# Altium project Smart-Switch-v1.1.PrjPcb (part 2 of 2)

## Sheet Power-Sheet.SchDoc
size A4; SheetNumber: 2; SheetTotal: 3
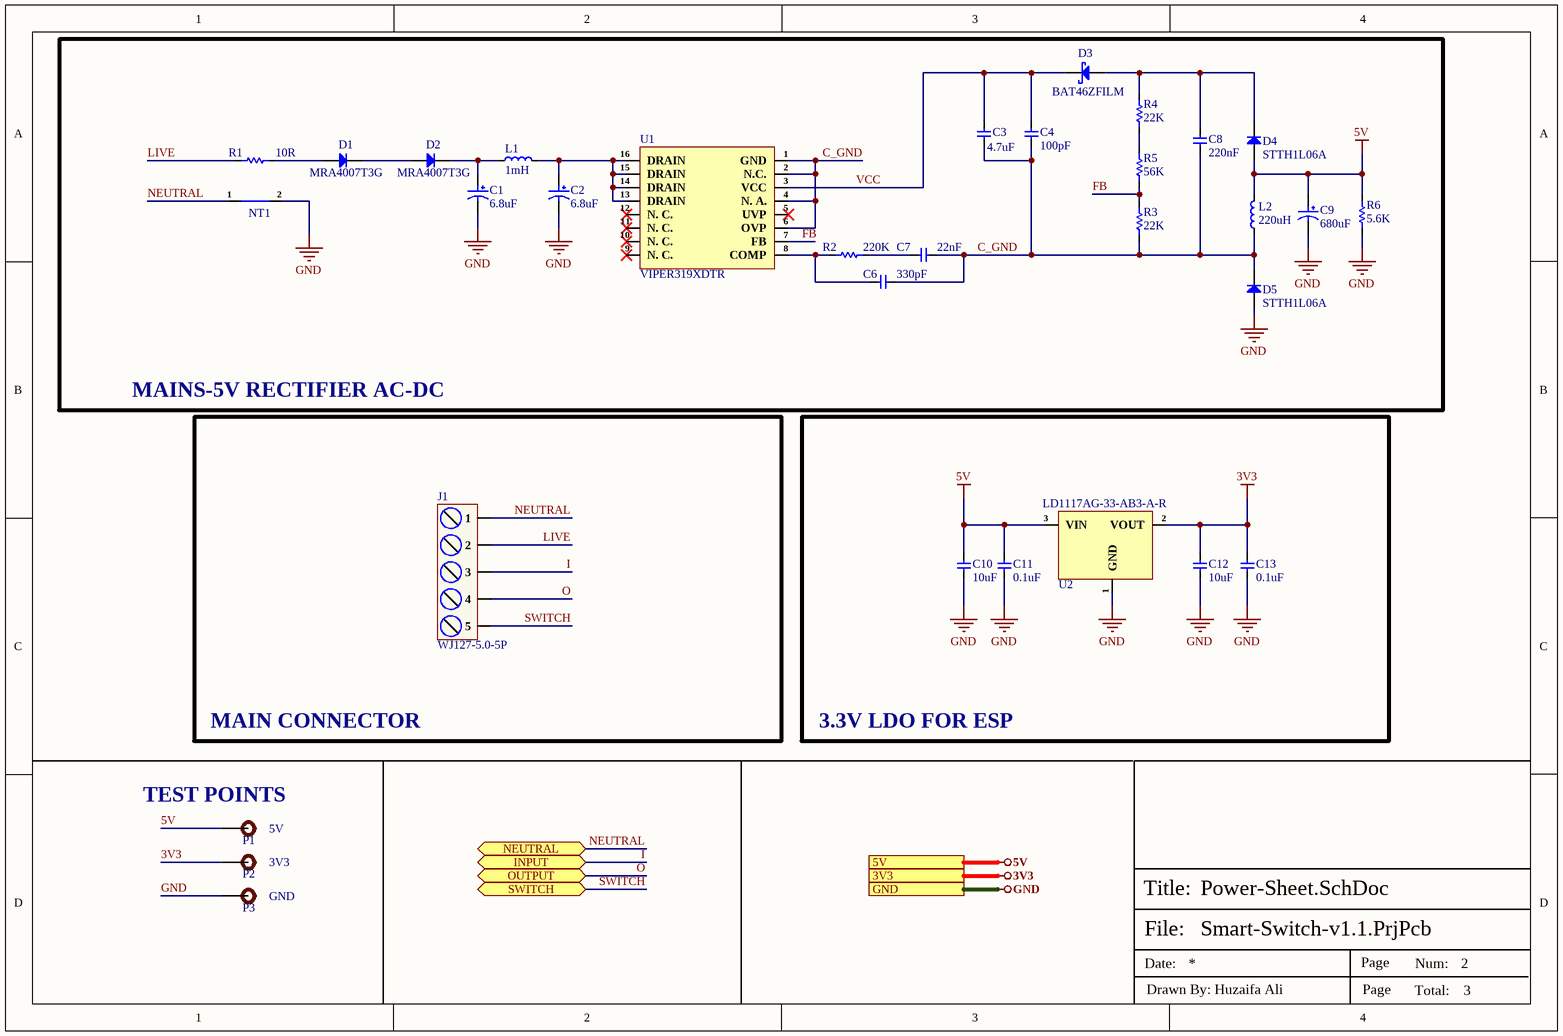
[diagram p2: Power-Sheet.SchDoc]

### Parts
C1  6.8uF  [6.8UF400V87EC0241]
C2  6.8uF  [6.8UF400V87EC0241]
C3  4.7uF  [Cap-1206]
C4  100pF  [Cap-0805]
C6  330pF  [Cap-0603]
C7  22nF  [Cap-0603]
C8  220nF  [Cap-1206]
C9  680uF  [SHW680UF10V6.3X11]
C10  10uF  [Cap-0603]
C11  0.1uF  [CAP-0201]
C12  10uF  [Cap-0402]
C13  0.1uF  [CAP-0201]
D1  MRA4007T3G  [SMA]
D2  MRA4007T3G  [SMA]
D3  BAT46ZFILM  [SOD-123]
D4  STTH1L06A  [SMA]
D5  STTH1L06A  [SMA]
J1  WJ127-5.0-5P  [WJ127-5.0-5P]
L1  1mH  [SPK0608-102MB]
L2  220uH  [YNR6045-221M]
NT1  Net Tie_SMD  [Net Tie Pad]  (value not drawn)  (net tie, no BOM)
P1  TEST POINT  [Test-point]  (value not drawn)
P2  TEST POINT  [Test-point]  (value not drawn)
P3  TEST POINT  [Test-point]  (value not drawn)
R1  10R  [MO2WS Vertical Type]
R2  220K  [Res-0603]
R3  22K  [Res-1206]
R4  22K  [Res-1206]
R5  56K  [Res-0603]
R6  5.6K  [RES-0805]
U1  VIPER319XDTR  [SOP-16]
U2  LD1117AG-33-AB3-A-R  [SOT-89-3]

### Blocks framed on the sheet
MAINS-5V RECTIFIER AC-DC: C1-C4 C6-C9 D1-D5 L1 L2 NT1 R1-R6 U1
MAIN CONNECTOR: J1
3.3V LDO FOR ESP: C10-C13 U2

### Ports
3V3 (see Top-Sheet[2B], Controller-Sheet[5D]), 5V (see Top-Sheet[2C], Controller-Sheet[5D]), GND (see Top-Sheet[2B], Controller-Sheet[5D]), INPUT (bidir, see Top-Sheet[2B], Controller-Sheet[5D]), NEUTRAL (bidir, see Top-Sheet[2C], Controller-Sheet[5D]), OUTPUT (bidir, see Top-Sheet[2B], Controller-Sheet[5D]), SWITCH (bidir, see Top-Sheet[2C], Controller-Sheet[5D])

### Nets
3V3: C12.2 C13.2 P2.1 U2.2(VOUT) ; port 3V3
5V: C9.1 C10.2 C11.2 D4.2(A) L2.2 P1.1 R6.2 U2.3(VIN) ; port 5V
GND: C1.2 C2.2 C9.2 C10.1 C11.1 C12.1 C13.1 D5.2(A) NT1.2 P3.1 R6.1 U2.1(GND) ; port GND
C_GND: C3.1 C4.1 C6.1 C7.1 C8.1 D5.1(K) L2.1 R3.1 U1.1(GND) U1.2(N.C.) U1.4(N._A.) U1.6(OVP)
FB: R3.2 R5.1 U1.7(FB)
I: J1.3 ; port INPUT
LIVE: J1.2 R1.2
NEUTRAL: J1.1 NT1.1 ; port NEUTRAL
O: J1.4 ; port OUTPUT
SWITCH: J1.5 ; port SWITCH
VCC: C3.2 C4.2 D3.2(K) U1.3(VCC)
NetC1_1: C1.1 D2.1(K) L1.1
NetC2_1: C2.1 L1.2 U1.13(DRAIN) U1.14(DRAIN) U1.15(DRAIN) U1.16(DRAIN)
NetC6_2: C6.2 R2.1 U1.8(COMP)
NetC7_2: C7.2 R2.2
NetC8_2: C8.2 D3.1(A) D4.1(K) R4.2
NetD1_1: D1.1(K) D2.2(A)
NetD1_2: D1.2(A) R1.1
NetR4_1: R4.1 R5.2

Not connected (* = marked no-connect by the designer): U1 5(UVP)* 9(N._C.)* 10(N._C.)* 11(N._C.)* 12(N._C.)*

### Notes on the sheet
- (near P1) TEST POINTS
- 5V
- 3V3
- GND
- File:
- Title:
- Date:
- Page
- Num:
- Total:
- Drawn By: Huzaifa Ali

### Library data of the parts
C1 C2 = 6.8UF400V87EC0241: 6.8uF 400V ±20% 118mA@100kHz Plugin,D8xL9mm Aluminum Electrolytic Capacitors - Leaded ROHS; Manufacturer: KNSCHA; Manufacturer Part Number: 6.8UF400V87EC0241; Package: Plugin,D8xL9mm; LCSC Part Number: C2803208; Item Type: Electrolytic Capacitor; ComponentLink1Description: LCSC; ComponentLink1URL: https://www.lcsc.com/product-detail/Aluminum-Electrolytic-Capacitors-Leaded_KNSCHA-6-8UF400V87EC0241_C2803208.html
C3 = CL31A475KB9LNNC: CAP CER 4.7UF 50V X5R 1206; Manufacturer: Samsung; Tolerance: 10%; Item Type: Capacitor; Supplier: Avnet; Supplier Part Number: CL31A475KB9LNNC; Manufacturer Part Number: CL31A475KB9LNNC; RoHS: Yes; Category: Ceramic Capacitors; Stock: 176000; Pricing: 4000=0.09189, 8000=0.08978, 16000=0.08767, 24000=0.08555, 32000=0.08344 (USD); Mounting Technology: Surface Mount; Case/Package: Ceramic; Case Code (Metric): 3216; Case Code (Imperial): 1206; Min Operating Temperature: -55°C; Max Operating Temperature: 85°C; Packaging: Tape and Reel; Value: 4.7uF; Voltage Rating: 50V; Dielectric: X5R; Series: CL; Package Quantity: 1; Length: 3.2mm; Width: 0.063inch; Depth: 1.6mm; Thickness: 0.039inch; Radiation Hardening: No; RoHS Compliant: Yes; ComponentLink1URL: https://datasheet.ciiva.com/25727/cl31a475kb9lnnc-25727168.pdf?src-supplier=Digi-Key; ComponentLink1Description: https://datasheet.ciiva.com/25727/cl31a475kb9lnnc-25727168.pdf?src-supplier=Digi-Key; ComponentLink2URL: https://datasheet.ciiva.com/26838/getdatasheetpartid-359646-26838869.pdf?src-supplier=Verical; ComponentLink2Description: https://datasheet.ciiva.com/26838/getdatasheetpartid-359646-26838869.pdf?src-supplier=Verical; LCSC Part Number: C318753
C4 = CC0805KRX7R9BB101: CAP CER 100PF 50V X7R 0805; Manufacturer: Yageo; Item Type: Capacitor; Supplier: Future Electronics; Supplier Part Number: 3327608; Manufacturer Part Number: CC0805KRX7R9BB101; RoHS: Yes; Category: Ceramic Capacitors; Stock: 516000; Pricing: 4000=0.0077, 16000=0.0073, 60000=0.007, 100000=0.0068, 200000=0.0065 (USD); ComponentLink1URL: https://datasheet.ciiva.com/11465/upy-gphc-x7r-6-3v-to-50v-8-11465306.pdf?src-supplier=Avnet; ComponentLink1Description: https://datasheet.ciiva.com/11465/upy-gphc-x7r-6-3v-to-50v-8-11465306.pdf?src-supplier=Avnet; LCSC Part Number: C107140
C6 = CC0603KRX7R9BB331: CAP CER 330PF 50V X7R 0603; Manufacturer: Yageo; Item Type: Capacitor; Supplier: Future Electronics; Supplier Part Number: 4215935; Manufacturer Part Number: CC0603KRX7R9BB331; RoHS: Yes; Category: Ceramic Capacitors; Stock: 856000; Pricing: 4000=0.0051, 16000=0.0048, 60000=0.0045, 160000=0.0044, 400000=0.0041 (USD); ComponentLink1URL: https://datasheet.ciiva.com/144/mlccorderingcode-144454.pdf?src-supplier=Digi-Key; ComponentLink1Description: https://datasheet.ciiva.com/144/mlccorderingcode-144454.pdf?src-supplier=Digi-Key; ComponentLink2URL: https://datasheet.ciiva.com/144/mlccorderingcode-144455.pdf?src-supplier=Digi-Key; ComponentLink2Description: https://datasheet.ciiva.com/144/mlccorderingcode-144455.pdf?src-supplier=Digi-Key; ComponentLink3URL: https://datasheet.ciiva.com/144/mlccorderingcode-144456.pdf?src-supplier=Digi-Key; ComponentLink3Description: https://datasheet.ciiva.com/144/mlccorderingcode-144456.pdf?src-supplier=Digi-Key; ComponentLink4URL: https://datasheet.ciiva.com/11465/upy-gphc-x7r-6-3v-to-50v-8-11465240.pdf?src-supplier=Avnet; ComponentLink4Description: https://datasheet.ciiva.com/11465/upy-gphc-x7r-6-3v-to-50v-8-11465240.pdf?src-supplier=Avnet; ComponentLink5URL: https://datasheet.ciiva.com/8033/1489800-8033879.pdf?src-supplier=Element14; ComponentLink5Description: https://datasheet.ciiva.com/8033/1489800-8033879.pdf?src-supplier=Element14; ComponentLink6URL: https://datasheet.ciiva.com/8033/1489800-8033881.pdf?src-supplier=Element14; ComponentLink6Description: https://datasheet.ciiva.com/8033/1489800-8033881.pdf?src-supplier=Element14; ComponentLink7URL: https://datasheet.ciiva.com/7978/1489800-7978174.pdf?src-supplier=Element14; ComponentLink7Description: https://datasheet.ciiva.com/7978/1489800-7978174.pdf?src-supplier=Element14; LCSC Part Number: C107087
C7 = CC0603KRX7R9BB223: CAP CER 0.022UF 50V X7R 0603; Manufacturer: Yageo; Dielectric Material: Ceramic; Tolerance: 10%; Insulation Resistance: 100GR; Item Type: Capacitor; Supplier 1: Digi-Key; Manufacturer Part Number: CC0603KRX7R9BB223; RoHS: Yes; Category: Ceramic Capacitors; Stock 1: 119735; Pricing 1: 1=0.10000, 10=0.05500, 50=0.03020, 100=0.02460, 500=0.01760, 1000=0.01383 (USD); Mount: Surface Mount; Case/Package: 0603; Number of Pins: 2; Case Code (Metric): 1608; Case Code (Imperial): 0603; Min Operating Temperature: -55°C; Max Operating Temperature: 125°C; Capacitance: 22nF; Dielectric: X7R; Voltage: 50V; Package Quantity: 1; Voltage Rating: 50V; Packaging: Tape and Reel; Voltage Rating (DC): 50V; Termination: SMD/SMT; Resistor Type: Ceramic; Series: CC; Length: 1.6mm; Width: 0.031inch; Height: 0.8mm; Depth: 0.8mm; Thickness: 0.035inch; Radiation Hardening: No; RoHS Compliant: Yes; REACH SVHC: No SVHC; Lead Free: Lead Free; Halogen Free: Halogen Free; ComponentLink1URL: https://datasheet.ciiva.com/8033/70765-8033869.pdf?src-supplier=Element14; ComponentLink1Description: https://datasheet.ciiva.com/8033/70765-8033869.pdf?src-supplier=Element14; ComponentLink2URL: https://datasheet.ciiva.com/28450/1489800-28450639.pdf?src-supplier=Element14; ComponentLink2Description: https://datasheet.ciiva.com/28450/1489800-28450639.pdf?src-supplier=Element14; ComponentLink3URL: https://datasheet.ciiva.com/8033/1489800-8033867.pdf?src-supplier=Element14; ComponentLink3Description: https://datasheet.ciiva.com/8033/1489800-8033867.pdf?src-supplier=Element14; ComponentLink4URL: https://datasheet.ciiva.com/8033/1489800-8033865.pdf?src-supplier=Element14; ComponentLink4Description: https://datasheet.ciiva.com/8033/1489800-8033865.pdf?src-supplier=Element14; ComponentLink5URL: https://datasheet.ciiva.com/156/mlccorderingcode-156178.pdf?src-supplier=Digi-Key; ComponentLink5Description: https://datasheet.ciiva.com/156/mlccorderingcode-156178.pdf?src-supplier=Digi-Key; ComponentLink6URL: https://datasheet.ciiva.com/156/mlccorderingcode-156177.pdf?src-supplier=Digi-Key; ComponentLink6Description: https://datasheet.ciiva.com/156/mlccorderingcode-156177.pdf?src-supplier=Digi-Key; ComponentLink7URL: https://datasheet.ciiva.com/156/mlccorderingcode-156179.pdf?src-supplier=Digi-Key; ComponentLink7Description: https://datasheet.ciiva.com/156/mlccorderingcode-156179.pdf?src-supplier=Digi-Key; ComponentLink8URL: https://datasheet.ciiva.com/11464/upy-gphc-x7r-6-3v-to-50v-8-11464741.pdf?src-supplier=Avnet; ComponentLink8Description: https://datasheet.ciiva.com/11464/upy-gphc-x7r-6-3v-to-50v-8-11464741.pdf?src-supplier=Avnet; Supplier Part Number 1: 311-1370-1-ND; LCSC Part Number: C106222
C8 = CC1206JKX7R9BB224: CAP CER 0.22UF 50V X7R 1206; Manufacturer: Yageo; Item Type: Capacitor; Supplier: Future Electronics; Supplier Part Number: 4639209; Manufacturer Part Number: CC1206JKX7R9BB224; RoHS: Yes; Category: Ceramic Capacitors; Stock: 3000; Pricing: 3000=0.0381, 9000=0.0366, 15000=0.036, 30000=0.0351, 60000=0.0337 (USD); ComponentLink1URL: https://datasheet.ciiva.com/13210/upy-gp-np0-16v-to-50v-8-13210060.pdf?src-supplier=Mouser; ComponentLink1Description: https://datasheet.ciiva.com/13210/upy-gp-np0-16v-to-50v-8-13210060.pdf?src-supplier=Mouser; ComponentLink2URL: https://datasheet.ciiva.com/11466/upy-gphc-x7r-6-3v-to-50v-8-11466351.pdf?src-supplier=Avnet; ComponentLink2Description: https://datasheet.ciiva.com/11466/upy-gphc-x7r-6-3v-to-50v-8-11466351.pdf?src-supplier=Avnet; LCSC Part Number: C527274
C9 = SHW680UF10V6.3X11: 680uF 10V 50mΩ@300kHz ±20% 980mA@100kHz Plugin,D6.3xL11mm Aluminum Electrolytic Capacitors - Leaded ROHS; Manufacturer: KNSCHA; Manufacturer Part Number: SHW680UF10V6.3X11; Package: Plugin,D6.3xL11mm; LCSC Part Number: C494547; Item Type: Electrolytic Capacitor; ComponentLink1Description: LCSC; ComponentLink1URL: https://www.lcsc.com/product-detail/Aluminum-Electrolytic-Capacitors-Leaded_KNSCHA-SHW680UF10V6-3X11_C494547.html
C10 = GRM188R61E106KA73D: CAP CER 10UF 25V X5R 0603; Manufacturer: Murata; Supplier 1: Mouser; Manufacturer Part Number: GRM188R61E106KA73D; RoHS: Yes; Category: Ceramic Capacitors; Stock 1: 319428; Pricing 1: 1=0.36000, 10=0.25800, 50=0.25800, 100=0.15500, 1000=0.09800, 10000=0.06900 (USD); Case/Package: 0603; RoHS Compliant: Yes; ComponentLink1URL: https://search.murata.co.jp/Ceramy/image/img/A01X/G101/ENG/GRM188R61E106KA73-01.pdf?src-supplier=Digi-Key; ComponentLink1Description: https://search.murata.co.jp/Ceramy/image/img/A01X/G101/ENG/GRM188R61E106KA73-01.pdf?src-supplier=Digi-Key; Supplier Part Number 1: 81-GRM188R61E106KA3D; LCSC Part Number: C344022
C11 C13 = GRM033R61E104KE14D: CAP CER 0.1UF 25V X5R 0201; Manufacturer: Murata; Tolerance: 10%; Item Type: Capacitor; Material: 4241ConductorMaterial; Value: 100nF; Manufacturer Part Number: GRM033R61E104KE14D; RoHS: Yes; Category: Ceramic Capacitors; Case/Package: 0201; Case Code (Metric): 0603; Case Code (Imperial): 0201; Weight: 1.2E-05oz; Min Operating Temperature: -55°C; Max Operating Temperature: 85°C; Packaging: Tape and Reel; Voltage Rating: 25V; Dielectric: X5R; Termination: SMD/SMT; Voltage Rating (DC): 25V; Package Quantity: 15000; Series: GRM; Length: 0.024inch; Width: 0.012inch; Height: 0.3mm; Thickness: 0.013inch; Lead Free: Lead Free; RoHS Compliant: Yes; ComponentLink1URL: http://www.farnell.com/datasheets/2867843.pdf?src-supplier=Farnell; ComponentLink1Description: http://www.farnell.com/datasheets/2867843.pdf?src-supplier=Farnell; ComponentLink2URL: http://www.mouser.com/ds/2/281/c02e-2905.pdf?src-supplier=Mouser; ComponentLink2Description: http://www.mouser.com/ds/2/281/c02e-2905.pdf?src-supplier=Mouser; ComponentLink3URL: https://datasheet.octopart.com/GRM033R61E104KE14D-Murata-datasheet-22122223.pdf?src-supplier=Future+Electronics; ComponentLink3Description: https://datasheet.octopart.com/GRM033R61E104KE14D-Murata-datasheet-22122223.pdf?src-supplier=Future+Electronics; ComponentLink4URL: http://www.farnell.com/datasheets/2867843.pdf?src-supplier=Element14; ComponentLink4Description: http://www.farnell.com/datasheets/2867843.pdf?src-supplier=Element14; ComponentLink5URL: http://search.murata.co.jp/Ceramy/image/img/A01X/G101/ENG/GRM033R61E104KE14-01.pdf?src-supplier=Digi-Key; ComponentLink5Description: http://search.murata.co.jp/Ceramy/image/img/A01X/G101/ENG/GRM033R61E104KE14-01.pdf?src-supplier=Digi-Key; LCSC Part Number: C76939; Supplier: Rs; Supplier Part Number: 1852066; Stock: 14000; Pricing: 1000=0.008, 5000=0.007, 10000=0.006 (GBP); Mounting Technology: Surface Mount; ComponentLink6URL: http://www.farnell.com/datasheets/2867843.pdf?src-supplier=Newark; ComponentLink6Description: http://www.farnell.com/datasheets/2867843.pdf?src-supplier=Newark; ComponentLink7URL: https://datasheet.octopart.com/GRM033R61E104KE14D-Murata-datasheet-165579666.pdf?src-supplier=TME; ComponentLink7Description: https://datasheet.octopart.com/GRM033R61E104KE14D-Murata-datasheet-165579666.pdf?src-supplier=TME
C12 = CL05A106MP5NUNC: CAP CER 10UF 10V X5R 0402; Manufacturer: Samsung; Tolerance: 20%; Item Type: Capacitor; Supplier 1: Avnet; Manufacturer Part Number: CL05A106MP5NUNC; RoHS: Yes; Category: Ceramic Capacitors; Stock 1: 1729850; Pricing 1: 10000=0.02537 (USD); Case/Package: 0402; RoHS Compliant: Yes; ComponentLink1URL: https://datasheet.ciiva.com/25721/cl05a106mp5nunc-25721584.pdf?src-supplier=Digi-Key; ComponentLink1Description: https://datasheet.ciiva.com/25721/cl05a106mp5nunc-25721584.pdf?src-supplier=Digi-Key; Supplier Part Number 1: CL05A106MP5NUNC; LCSC Part Number: C315248; Mount: Surface Mount; Case Code (Metric): 1005; Case Code (Imperial): 0402; Contact Plating: Tin; Min Operating Temperature: -55°C; Max Operating Temperature: 85°C; Package Quantity: 1; Packaging: Tape and Reel; Capacitance: 10uF; Voltage Rating: 10V; Dielectric: X5R; Termination: Wraparound; Series: CL; Construction: Flat; Length: 1mm; Width: 0.02inch; Thickness: 0.028inch; Depth: 0.5mm; Radiation Hardening: No; Lead Free: Lead Free; ComponentLink2URL: https://datasheet.ciiva.com/26838/getdatasheetpartid-745310-26838170.pdf?src-supplier=Verical; ComponentLink2Description: https://datasheet.ciiva.com/26838/getdatasheetpartid-745310-26838170.pdf?src-supplier=Verical
D1 D2 = MRA4007T3G: DIODE GEN PURP 1KV 1A SMA; Manufacturer: ON Semiconductor; Max Surge Current: 30A; Forward Voltage: 1.18V; Max Reverse Current: 10uA; Polarity: Standard; Supplier: Arrow Electronics; Supplier Part Number: MRA4007T3G; Manufacturer Part Number: MRA4007T3G; RoHS: Yes; Category: Rectifier Diodes; Stock: 240000; Pricing: 20000=0.0492, 25000=0.0487, 50000=0.0483, 100000=0.0476 (USD); Case/Package: SMA; Pins: 2; Min Operating Temperature: -55°C; Max Operating Temperature: 175°C; Package Quantity: 1; Forward Current: 1A; Packaging: Tape and Reel; Average Rectified Current: 1A; Max Repetitive Reverse Voltage (Vrrm): 1kV; Max Forward Surge Current (Ifsm): 30A; Peak Non-Repetitive Surge Current: 30A; Voltage Rating (DC): 1kV; Current Rating: 1A; Output Current: 1A; Max Reverse Voltage (DC): 1kV; Reverse Voltage: 1kV; Series: -; Length: 4.32mm; Width: 2.6mm; Height: 2mm; Radiation Hardening: No; Reach SVHC Compliant: No; Lead Free: Lead Free; RoHS Compliant: Yes; ComponentLink1URL: https://datasheet.ciiva.com/34303/2013551-34303843.pdf?src-supplier=Jameco; ComponentLink1Description: https://datasheet.ciiva.com/34303/2013551-34303843.pdf?src-supplier=Jameco; ComponentLink2URL: https://datasheet.ciiva.com/30479/0900766b8078eb75-30479272.pdf?src-supplier=Rs; ComponentLink2Description: https://datasheet.ciiva.com/30479/0900766b8078eb75-30479272.pdf?src-supplier=Rs; ComponentLink3URL: https://datasheet.ciiva.com/7962/mra4003t3-d-7962843.pdf?src-supplier=Element14; ComponentLink3Description: https://datasheet.ciiva.com/7962/mra4003t3-d-7962843.pdf?src-supplier=Element14; ComponentLink4URL: https://datasheet.ciiva.com/7962/mra4003t3-d-7962842.pdf?src-supplier=Element14; ComponentLink4Description: https://datasheet.ciiva.com/7962/mra4003t3-d-7962842.pdf?src-supplier=Element14; ComponentLink5URL: https://datasheet.ciiva.com/22749/1747991-22749573.pdf?src-supplier=Element14; ComponentLink5Description: https://datasheet.ciiva.com/22749/1747991-22749573.pdf?src-supplier=Element14; ComponentLink6URL: https://datasheet.ciiva.com/14558/70099554-14558476.pdf?src-supplier=Allied+Electronics; ComponentLink6Description: https://datasheet.ciiva.com/14558/70099554-14558476.pdf?src-supplier=Allied+Electronics; ComponentLink7URL: https://datasheet.ciiva.com/8299/mra4003t3-d-8299900.pdf?src-supplier=Avnet; ComponentLink7Description: https://datasheet.ciiva.com/8299/mra4003t3-d-8299900.pdf?src-supplier=Avnet; LCSC Part Number: C47921; Item Type: Diode
D3 = BAT46ZFILM: DIODE SCHOTTKY 100V 150MA SOD123; Manufacturer: STMicroelectronics; Peak Non-Repetitive Surge Current: 1A; Forward Voltage: 1V; Max Reverse Current: 5uA; Polarity: Standard; Current Rating: 160mA; Value: 10pF; Item Type: Schottky Diode; Supplier: Mouser; Supplier Part Number: 511-BAT46ZFILM; Manufacturer Part Number: BAT46ZFILM; RoHS: Yes; Category: Rectifier Diodes; Stock: 123459; Pricing: 1=0.44, 10=0.307, 50=0.307, 100=0.124, 1000=0.093, 10000=0.064 (USD); Mounting Technology: Surface Mount; Pins: 2; Min Operating Temperature: -65°C; Max Operating Temperature: 150°C; Forward Current: 150mA; Max Repetitive Reverse Voltage (Vrrm): 100V; Max Surge Current: 1A; Package Quantity: 3000; Packaging: Tape and Reel; Max Reverse Leakage Current: 5uA; Average Rectified Current: 150mA; Max Forward Surge Current (Ifsm): 1A; Voltage Rating (DC): 100V; Output Current: 150mA; Max Reverse Voltage (DC): 100V; Series: -; Length: 2.85mm; Width: 1.7mm; Height: 1.35mm; Radiation Hardening: No; Reach SVHC Compliant: No; Lead Free: Lead Free; RoHS Compliant: Yes; ComponentLink1URL: https://datasheet.ciiva.com/23920/cd00004930-23920128.pdf?src-supplier=Newark; ComponentLink1Description: https://datasheet.ciiva.com/23920/cd00004930-23920128.pdf?src-supplier=Newark; ComponentLink2URL: https://datasheet.ciiva.com/14168/cd00004930-14168058.pdf?src-supplier=Distrelec; ComponentLink2Description: https://datasheet.ciiva.com/14168/cd00004930-14168058.pdf?src-supplier=Distrelec; ComponentLink3URL: https://datasheet.ciiva.com/4714/cd00004930-111868-4714530.pdf?src-supplier=Mouser; ComponentLink3Description: https://datasheet.ciiva.com/4714/cd00004930-111868-4714530.pdf?src-supplier=Mouser; ComponentLink4URL: https://datasheet.ciiva.com/17097/bat46zfilm-17097700.pdf?src-supplier=Allied+Electronics; ComponentLink4Description: https://datasheet.ciiva.com/17097/bat46zfilm-17097700.pdf?src-supplier=Allied+Electronics; ComponentLink5URL: https://datasheet.ciiva.com/22733/1761349-22733179.pdf?src-supplier=Element14; ComponentLink5Description: https://datasheet.ciiva.com/22733/1761349-22733179.pdf?src-supplier=Element14; ComponentLink6URL: https://datasheet.ciiva.com/915/cd00004930-915572.pdf?src-supplier=Digi-Key; ComponentLink6Description: https://datasheet.ciiva.com/915/cd00004930-915572.pdf?src-supplier=Digi-Key; ComponentLink7URL: https://datasheet.ciiva.com/915/cd00004930-915571.pdf?src-supplier=Digi-Key; ComponentLink7Description: https://datasheet.ciiva.com/915/cd00004930-915571.pdf?src-supplier=Digi-Key; ComponentLink8URL: https://datasheet.ciiva.com/915/cd00004930-915573.pdf?src-supplier=Digi-Key; ComponentLink8Description: https://datasheet.ciiva.com/915/cd00004930-915573.pdf?src-supplier=Digi-Key; ComponentLink9URL: https://datasheet.ciiva.com/16221/cd00004930-16221159.pdf?src-supplier=Future+Electronics; ComponentLink9Description: https://datasheet.ciiva.com/16221/cd00004930-16221159.pdf?src-supplier=Future+Electronics; ComponentLink10URL: https://datasheet.ciiva.com/15144/getdatasheetpartid-89559-15144645.pdf?src-supplier=Verical; ComponentLink10Description: https://datasheet.ciiva.com/15144/getdatasheetpartid-89559-15144645.pdf?src-supplier=Verical; LCSC Part Number: C283255
D4 D5 = STTH1L06A: Diode Standard 600V 1A Surface Mount SMA; Manufacturer: STMicroelectronics; Max Reverse Current: 1uA; Reverse Recovery Time: 80ns; Peak Non-Repetitive Surge Current: 20A; Forward Voltage: 1.3V; Max Forward Surge Current (Ifsm): 10A; Supplier: Mouser; Supplier Part Number: 511-STTH1L06A; Manufacturer Part Number: STTH1L06A; RoHS: Yes; Category: Rectifier Diodes; Stock: 400; Pricing: 1=0.44, 10=0.377, 50=0.377, 100=0.283, 1000=0.163, 10000=0.138 (USD); Mounting Technology: Surface Mount; Case/Package: SMA; Pins: 2; Min Operating Temperature: -65°C; Max Operating Temperature: 175°C; Forward Current: 1A; Max Repetitive Reverse Voltage (Vrrm): 600V; Package Quantity: 1; Packaging: Tape and Reel; Max Surge Current: 20A; Recovery Time: 80ns; Average Rectified Current: 1A; Polarity: Standard; Voltage Rating (DC): 600V; Output Current: 1A; Current Rating: 1A; Max Reverse Voltage (DC): 600V; Reverse Voltage: 600V; Series: -; Reverse Recovery Time-Max: 80ns; Length: 4.6mm; Width: 2.95mm; Height: 2.03mm; Radiation Hardening: No; Reach SVHC Compliant: No; Lead Free: Lead Free; RoHS Compliant: Yes; ComponentLink1URL: https://datasheet.ciiva.com/915/cd00002694-915859.pdf?src-supplier=Digi-Key; ComponentLink1Description: https://datasheet.ciiva.com/915/cd00002694-915859.pdf?src-supplier=Digi-Key; ComponentLink2URL: https://datasheet.ciiva.com/915/cd00002694-915858.pdf?src-supplier=Digi-Key; ComponentLink2Description: https://datasheet.ciiva.com/915/cd00002694-915858.pdf?src-supplier=Digi-Key; ComponentLink3URL: https://datasheet.ciiva.com/915/cd00002694-915860.pdf?src-supplier=Digi-Key; ComponentLink3Description: https://datasheet.ciiva.com/915/cd00002694-915860.pdf?src-supplier=Digi-Key; ComponentLink4URL: https://datasheet.ciiva.com/7964/1671053-7964013.pdf?src-supplier=Element14; ComponentLink4Description: https://datasheet.ciiva.com/7964/1671053-7964013.pdf?src-supplier=Element14; ComponentLink5URL: https://datasheet.ciiva.com/7964/1671053-7964014.pdf?src-supplier=Element14; ComponentLink5Description: https://datasheet.ciiva.com/7964/1671053-7964014.pdf?src-supplier=Element14; ComponentLink6URL: https://datasheet.ciiva.com/26818/getdatasheetpartid-65243-26818021.pdf?src-supplier=Verical; ComponentLink6Description: https://datasheet.ciiva.com/26818/getdatasheetpartid-65243-26818021.pdf?src-supplier=Verical; LCSC Part Number: C98801; Item Type: Diode
J1 = WJ127-5.0-5P: 1x5P -40℃~+105℃ 15A 250V Green 14~26 Straight pin 5mm 1.5 1 5 Plugin,P=5mm Screw terminal ROHS; Manufacturer: Ningbo Kangnex Elec; ComponentLink1Description: LCSC; ComponentLink1URL: https://www.lcsc.com/product-detail/Screw-terminal_Ningbo-Kangnex-Elec-WJ127-5-0-5P_C192780.html; Manufacturer Part Number: WJ127-5.0-5P; Package: Plugin,P=5mm; LCSC Part Number: C192780; Item Type: Screw terminal
L1 = SPK0608-102MB: 200mA 1mH ±20% Plugin,D7xL11mm Color Ring Inductors/Through Hole Inductors ROHS; Manufacturer: LanTu Micro; ComponentLink1Description: LCSC; ComponentLink1URL: https://www.lcsc.com/product-detail/Color-Ring-Inductors-Through-Hole-Inductors_LanTu-Micro-SPK0608-102MB_C5127530.html; Manufacturer Part Number: SPK0608-102MB; Package: Plugin,D7xL11mm; LCSC Part Number: C5127530; Item Type: Through Hole Inductor
L2 = YNR6045-221M: 590mA 220uH ±20% SMD,6x6mm Power Inductors ROHS; Manufacturer: YJYCOIN; Manufacturer Part Number: YNR6045-221M; Package: SMD,6x6mm; LCSC Part Number: C497842; Item Type: Inductor; ComponentLink1Description: LCSC; ComponentLink1URL: https://www.lcsc.com/product-detail/Power-Inductors_YJYCOIN-YNR6045-221M_C497842.html
NT1 = Net Tie_SMD: Net Tie SMD; Manufacturer Part Number: Net Tie; Item Type: Net Tie Pad
P1-P3 = TEST POINT: Test Point ON; Item Type: TEST POINT
R1 = Vertical Resistor: Metal Oxide Resistors 10Ω 2W ±350ppm/℃ ±5% Plugin Through Hole Resistors ROHS; Manufacturer: VO; Manufacturer Part Number: MO2WS-10Ω±5%-6T63; Package: Plugin; LCSC Part Number: C601001; Item Type: Through Hole Resistor; ComponentLink1Description: LCSC; ComponentLink1URL: https://www.lcsc.com/product-detail/Through-Hole-Resistors_VO-MO2WS-10-5-6T63_C601001.html
R2 = CRGCQ0603F220K: RES 220K OHM 1% 1/10W 0603; Manufacturer: TE Connectivity; Power Rating: 100mW; Voltage Rating: 75V; Item Type: Resistor; Supplier: Avnet; Supplier Part Number: 73AC9080; Manufacturer Part Number: CRGCQ0603F220K; RoHS: Yes; Category: Chip SMD Resistors; Stock: 4740; Pricing: 1=0.006 (USD); Voltage Rating (DC): 75V; Height: 550um; ComponentLink1URL: http://datasheet.octopart.com/CRGCQ0603F220K-TE-Connectivity-datasheet-114679081.pdf?src-supplier=Newark; ComponentLink1Description: http://datasheet.octopart.com/CRGCQ0603F220K-TE-Connectivity-datasheet-114679081.pdf?src-supplier=Newark; ComponentLink2URL: http://datasheet.octopart.com/CRGCQ0603F220K-TE-Connectivity-datasheet-114679081.pdf?src-supplier=Verical; ComponentLink2Description: http://datasheet.octopart.com/CRGCQ0603F220K-TE-Connectivity-datasheet-114679081.pdf?src-supplier=Verical; ComponentLink3URL: http://datasheet.octopart.com/CRGCQ0603F220K-TE-Connectivity-datasheet-114679081.pdf?src-supplier=Digi-Key; ComponentLink3Description: http://datasheet.octopart.com/CRGCQ0603F220K-TE-Connectivity-datasheet-114679081.pdf?src-supplier=Digi-Key; ComponentLink4URL: https://www.te.com/commerce/DocumentDelivery/DDEController?Action=srchrtrv&amp;DocNm=1773204-3&amp;DocType=DS&amp;DocLang=English&src-supplier=Digi-Key; ComponentLink4Description: https://www.te.com/commerce/DocumentDelivery/DDEController?Action=srchrtrv&amp;DocNm=1773204-3&amp;DocType=DS&amp;DocLang=English&src-supplier=Digi-Key; ComponentLink5URL: http://datasheet.octopart.com/CRGCQ0603F220K-TE-Connectivity-datasheet-114679081.pdf?src-supplier=Avnet; ComponentLink5Description: http://datasheet.octopart.com/CRGCQ0603F220K-TE-Connectivity-datasheet-114679081.pdf?src-supplier=Avnet; ComponentLink6URL: https://4donline.ihs.com/images/VipMasterIC/IC/TYEL/TYEL-S-A0004929575/TYEL-S-A0004929575-1.pdf?hkey=52A5661711E402568146F3353EA87419&src-supplier=Farnell; ComponentLink6Description: https://4donline.ihs.com/images/VipMasterIC/IC/TYEL/TYEL-S-A0004929575/TYEL-S-A0004929575-1.pdf?hkey=52A5661711E402568146F3353EA87419&src-supplier=Farnell; ComponentLink7URL: http://datasheet.octopart.com/CRGCQ0603F220K-TE-Connectivity-datasheet-114679081.pdf?src-supplier=Mouser; ComponentLink7Description: http://datasheet.octopart.com/CRGCQ0603F220K-TE-Connectivity-datasheet-114679081.pdf?src-supplier=Mouser; ComponentLink8URL: https://4donline.ihs.com/images/VipMasterIC/IC/TYEL/TYEL-S-A0004929575/TYEL-S-A0004929575-1.pdf?hkey=52A5661711E402568146F3353EA87419&src-supplier=Newark; ComponentLink8Description: https://4donline.ihs.com/images/VipMasterIC/IC/TYEL/TYEL-S-A0004929575/TYEL-S-A0004929575-1.pdf?hkey=52A5661711E402568146F3353EA87419&src-supplier=Newark; ComponentLink9URL: https://datasheet.octopart.com/5-2176339-3-TE-Connectivity-datasheet-167977702.pdf?src-supplier=Future+Electronics; ComponentLink9Description: https://datasheet.octopart.com/5-2176339-3-TE-Connectivity-datasheet-167977702.pdf?src-supplier=Future+Electronics; ComponentLink10URL: http://datasheet.octopart.com/CRGCQ0603F220K-TE-Connectivity-datasheet-114679081.pdf?src-supplier=Onlinecomponents.com; ComponentLink10Description: http://datasheet.octopart.com/CRGCQ0603F220K-TE-Connectivity-datasheet-114679081.pdf?src-supplier=Onlinecomponents.com; ComponentLink11URL: https://datasheet.octopart.com/CRGCQ0603F220K-TE-Connectivity-datasheet-114679081.pdf?src-supplier=Master+Electronics; ComponentLink11Description: https://datasheet.octopart.com/CRGCQ0603F220K-TE-Connectivity-datasheet-114679081.pdf?src-supplier=Master+Electronics; ComponentLink12URL: http://datasheet.octopart.com/CRGCQ0603F220K-TE-Connectivity-datasheet-114679081.pdf?src-supplier=TME; ComponentLink12Description: http://datasheet.octopart.com/CRGCQ0603F220K-TE-Connectivity-datasheet-114679081.pdf?src-supplier=TME; ComponentLink13URL: http://datasheet.octopart.com/CRGCQ0603F220K-TE-Connectivity-datasheet-114679081.pdf?src-supplier=Sager+Electronics; ComponentLink13Description: http://datasheet.octopart.com/CRGCQ0603F220K-TE-Connectivity-datasheet-114679081.pdf?src-supplier=Sager+Electronics; ComponentLink14URL: http://datasheet.octopart.com/CRGCQ0603F220K-TE-Connectivity-datasheet-114679081.pdf?src-supplier=Heilind+Electronics; ComponentLink14Description: http://datasheet.octopart.com/CRGCQ0603F220K-TE-Connectivity-datasheet-114679081.pdf?src-supplier=Heilind+Electronics; ComponentLink15URL: http://datasheet.octopart.com/CRGCQ0603F220K-TE-Connectivity-datasheet-114679081.pdf?src-supplier=Electro+Sonic; ComponentLink15Description: http://datasheet.octopart.com/CRGCQ0603F220K-TE-Connectivity-datasheet-114679081.pdf?src-supplier=Electro+Sonic; ComponentLink16URL: http://datasheet.octopart.com/CRGCQ0603F220K-TE-Connectivity-datasheet-114679081.pdf?src-supplier=Interstate+Connecting+Components; ComponentLink16Description: http://datasheet.octopart.com/CRGCQ0603F220K-TE-Connectivity-datasheet-114679081.pdf?src-supplier=Interstate+Connecting+Components; LCSC Part Number: C4282892
R3 R4 = CRCW120622K0FKEAC: RES 22K OHM 1% 1/4W 1206; Manufacturer: Vishay; Item Type: Resistor; Supplier: Mouser; Supplier Part Number: 71-CRCW120622K0FKEAC; Manufacturer Part Number: CRCW120622K0FKEAC; RoHS: Yes; Category: Chip SMD Resistors; Stock: 118020; Pricing: 1=0.1, 10=0.036, 50=0.036, 100=0.016, 1000=0.011, 10000=0.007 (USD); RoHS Compliant: Yes; LCSC Part Number: C1511874
R5 = AC0603FR-0756KL: RES SMD 56K OHM 1% 1/10W 0603; Manufacturer: Yageo; Item Type: Resistor; Supplier: Future Electronics; Supplier Part Number: 4073924; Manufacturer Part Number: AC0603FR-0756KL; RoHS: Yes; Category: Chip SMD Resistors; Stock: 100000; Pricing: 5000=0.0016, 25000=0.0015, 150000=0.0014, 500000=0.0014, 1500000=0.0013 (USD); ComponentLink1URL: http://www.mouser.com/ds/2/447/yageodocoutput-1111992.pdf?src-supplier=Mouser; ComponentLink1Description: http://www.mouser.com/ds/2/447/yageodocoutput-1111992.pdf?src-supplier=Mouser; ComponentLink2URL: http://www.yageo.com/NewPortal/yageodocoutput?fileName=/pdf/R-Chip/PYu-AC_51_RoHS_L_6.pdf&src-supplier=Digi-Key; ComponentLink2Description: http://www.yageo.com/NewPortal/yageodocoutput?fileName=/pdf/R-Chip/PYu-AC_51_RoHS_L_6.pdf&src-supplier=Digi-Key; ComponentLink3URL: https://datasheet.octopart.com/AC0603FR-0756KL-Yageo-datasheet-151884373.pdf?src-supplier=Future+Electronics; ComponentLink3Description: https://datasheet.octopart.com/AC0603FR-0756KL-Yageo-datasheet-151884373.pdf?src-supplier=Future+Electronics; LCSC Part Number: C144647
R6 = CRCW08055K60FKEA: RES SMD 5.6K OHM 1% 1/8W 0805; Manufacturer: Vishay; Value: 5.6kR; Max Power Dissipation: 125mW; Temperature Coefficient: 100ppm/°C; Voltage Rating: 150V; Item Type: Resistor; Supplier: Rs; Supplier Part Number: 6791572P; Manufacturer Part Number: CRCW08055K60FKEA; RoHS: Yes; Category: Chip SMD Resistors; Stock: 100250; Pricing: 1250=0.024, 2500=0.013, 4000=0.015, 5000=0.011 (GBP); Case/Package: 0805; Pins: 2; Weight: 0.000194oz; Case Code (Imperial): 0805; Case Code (Metric): 2012; Contact Plating: Tin; Min Operating Temperature: -55°C; Max Operating Temperature: 155°C; Tolerance: 1%; Packaging: Tape and Reel; Number of Terminations: 2; Series: CRCW; Resistor Type: Thick Film; Package Quantity: 5000; Power Rating: 125mW; Termination: SMD/SMT; Voltage Rating (DC): 150V; Features: Automotive AEC-Q200; Technology: THICK FILM; Resistance Tolerance: 1%; Length: 2mm; Width: 1.25mm; Height: 0.45mm; Depth: 1.25mm; Ratings: AEC-Q200; RoHS Compliant: Yes; Reach SVHC Compliant: Unknown; ComponentLink1URL: https://datasheet.ciiva.com/11811/0900766b80d98b26-11811062.pdf?src-supplier=Rs; ComponentLink1Description: https://datasheet.ciiva.com/11811/0900766b80d98b26-11811062.pdf?src-supplier=Rs; ComponentLink2URL: https://datasheet.ciiva.com/2525/dcrcwe3-2525722.pdf?src-supplier=Digi-Key; ComponentLink2Description: https://datasheet.ciiva.com/2525/dcrcwe3-2525722.pdf?src-supplier=Digi-Key; ComponentLink3URL: https://datasheet.ciiva.com/16767/70201119-16767127.pdf?src-supplier=Allied+Electronics; ComponentLink3Description: https://datasheet.ciiva.com/16767/70201119-16767127.pdf?src-supplier=Allied+Electronics; ComponentLink4URL: https://datasheet.ciiva.com/7841/1697337-7841861.pdf?src-supplier=Element14; ComponentLink4Description: https://datasheet.ciiva.com/7841/1697337-7841861.pdf?src-supplier=Element14; ComponentLink5URL: https://datasheet.ciiva.com/26317/fld-crcw-e3-data-en-26317147.pdf?src-supplier=Distrelec; ComponentLink5Description: https://datasheet.ciiva.com/26317/fld-crcw-e3-data-en-26317147.pdf?src-supplier=Distrelec; ComponentLink6URL: https://datasheet.ciiva.com/7841/1697337-7841690.pdf?src-supplier=Element14; ComponentLink6Description: https://datasheet.ciiva.com/7841/1697337-7841690.pdf?src-supplier=Element14; ComponentLink7URL: https://datasheet.ciiva.com/22683/1847332-22683327.pdf?src-supplier=Element14; ComponentLink7Description: https://datasheet.ciiva.com/22683/1847332-22683327.pdf?src-supplier=Element14; ComponentLink8URL: https://datasheet.ciiva.com/2525/dcrcwe3-2525723.pdf?src-supplier=Digi-Key; ComponentLink8Description: https://datasheet.ciiva.com/2525/dcrcwe3-2525723.pdf?src-supplier=Digi-Key; ComponentLink9URL: https://datasheet.ciiva.com/2525/dcrcwe3-2525724.pdf?src-supplier=Digi-Key; ComponentLink9Description: https://datasheet.ciiva.com/2525/dcrcwe3-2525724.pdf?src-supplier=Digi-Key; ComponentLink10URL: https://datasheet.ciiva.com/9065/dcrcwe3-9065422.pdf?src-supplier=Avnet; ComponentLink10Description: https://datasheet.ciiva.com/9065/dcrcwe3-9065422.pdf?src-supplier=Avnet; LCSC Part Number: C844634
U1 = VIPER319XDTR: IC OFFLINE SWITCH MULT TOP 16SO; Manufacturer: STMicroelectronics; Supplier: Mouser; Supplier Part Number: 511-VIPER319XDTR; Manufacturer Part Number: VIPER319XDTR; RoHS: Yes; Category: Voltage Regulators - Switching; Stock: 1952; Pricing: 1=1.73, 10=1.55, 50=1.47, 100=1.21, 1000=0.786, 10000=0.696 (USD); Item Type: IC
U2 = LD1117AG-33-AB3-A-R: 75dB@(120Hz) 1A Fixed 3.3V~3.3V Positive 15V SOT-89-3 Linear Voltage Regulators (LDO) ROHS; Manufacturer: UTC; Item Type: IC; Manufacturer Part Number: LD1117AG-33-AB3-A-R; Package: SOT-89-3; LCSC Part Number: C81768; ComponentLink1Description: LCSC; ComponentLink1URL: https://www.lcsc.com/product-detail/Linear-Voltage-Regulators-LDO_UTC-Unisonic-Tech-LD1117AG-33-AB3-A-R_C81768.html

## Nets that join several sheets
3V3: Controller-Sheet (18 pins), Power-Sheet (C12.2 C13.2 P2.1 U2.2)
5V: Controller-Sheet (D6.2 K1.1), Power-Sheet (8 pins)
GND: Controller-Sheet (32 pins), Power-Sheet (12 pins)